# Altium project Curso_Titans.PrjPcb (part 1 of 4)
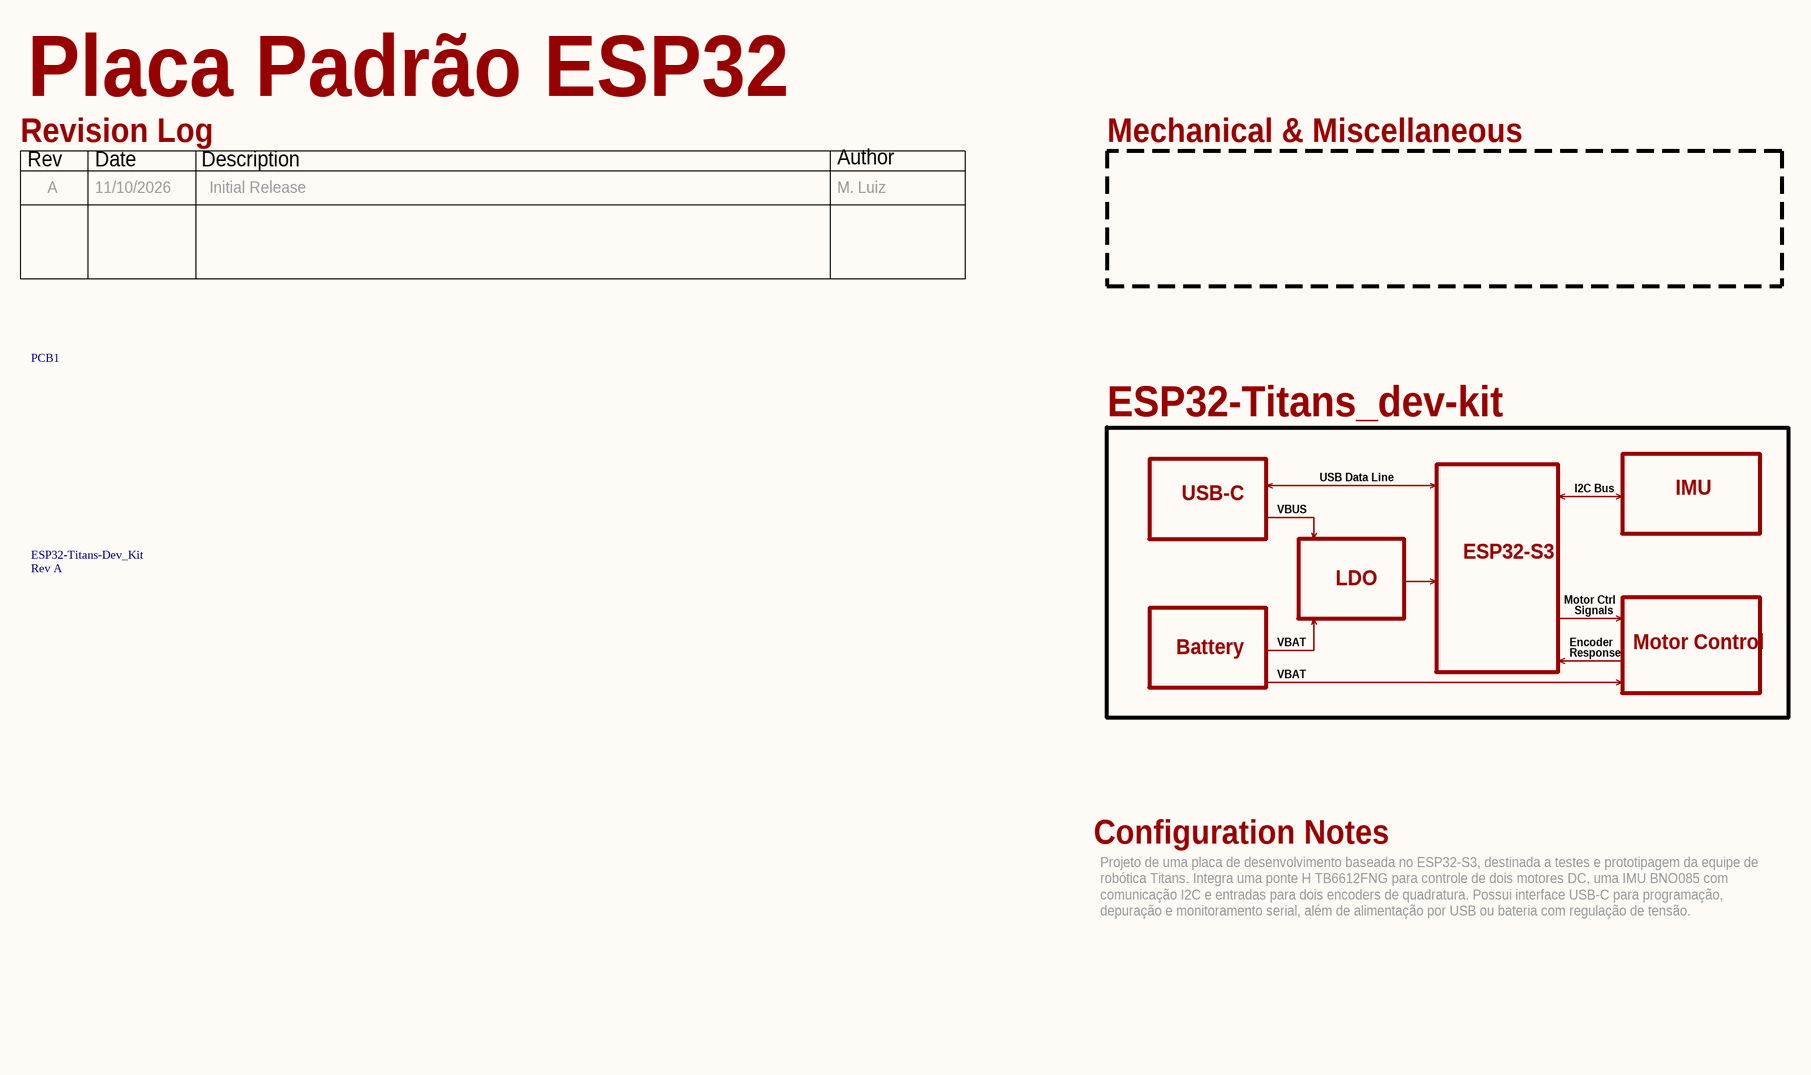
[diagram p0: cover.SchDoc]
Title: ESP32-Titans-dev_kit; Revision: A; Projeto: Curso Altium; DocumentNumber: 1; Date: 11/10/2026; CheckedBy: M. Luiz; BoardName: ESP32-Titans-Dev_Kit; Author: M. Luiz
5 sheets, 70 parts. Net scope: flat (ports and power ports of the same name join across sheets).
Board file: PCB1.PcbDoc
Sheets:
  cover.SchDoc
    ESP32-Titans_dev-kit = block_diagram.SchDoc
      Power & USB = power_supply.SchDoc
      Logic Control = logic_control.SchDoc
      Peripherials = peripherials.SchDoc

## Sheet cover.SchDoc: ESP32-Titans-Dev_kit
size 420 x 297 mm; Date: 13/10/2026; ApprovedBy: M. Luiz; CheckedBy: M. Luiz; Author: M. Luiz; CompanyName: Equipe de Robótica Titans; DrawnBy: M. Luiz; Engineer: M. Luiz; Organization: Equipe de Robótica Titans; DocumentNumber: 1; Revision: A; SheetNumber: 1; SheetTotal: 5; Projeto: Curso Altium

### Parts
PCB1  Project Name: ESP32-Titans-Dev_Kit  Board Revision: Rev A  [PCB_Logo]  (no BOM)

### Sub-sheets
ESP32-Titans_dev-kit = block_diagram.SchDoc: no entries

### Notes on the sheet
- Revision Log
- Placa Padrão ESP32
- Mechanical & Miscellaneous
- Rev
- A
- Date
- 11/10/2026
- Description
- Initial Release
- Author
- M. Luiz
- USB Data Line
- I2C Bus
- IMU
- USB-C
- VBUS
- ESP32-S3
- LDO
- Motor Ctrl
- Signals
- Battery
- VBAT
- Encoder
- Response
- Motor Control
- Configuration Notes
- Projeto de uma placa de desenvolvimento baseada no ESP32-S3, destinada a testes e prototipagem da equipe de robótica Titans. Integra uma ponte H TB6612FNG para controle de dois motores DC, uma IMU BNO085 com comunicação I2C e entradas para dois encoders de quadratura. Possui interface USB-C para programação, depuração e monitoramento serial, além de alimentação por USB ou bateria com regulação de tensão.
- Título:
- Equipe de Robótica Titans
- Projeto:
- Autor:
- Número:
- Aprovado por:
- Revisão:
- Data:
- Última Modificação:
- Página
- De

### Library data of the parts
PCB1 = BOARD INFO: Not Assembled PCB Component

## Sheet block_diagram.SchDoc: ESP32-Titans-dev_kit
size 420 x 297 mm; SheetNumber: 2; SheetTotal: 5
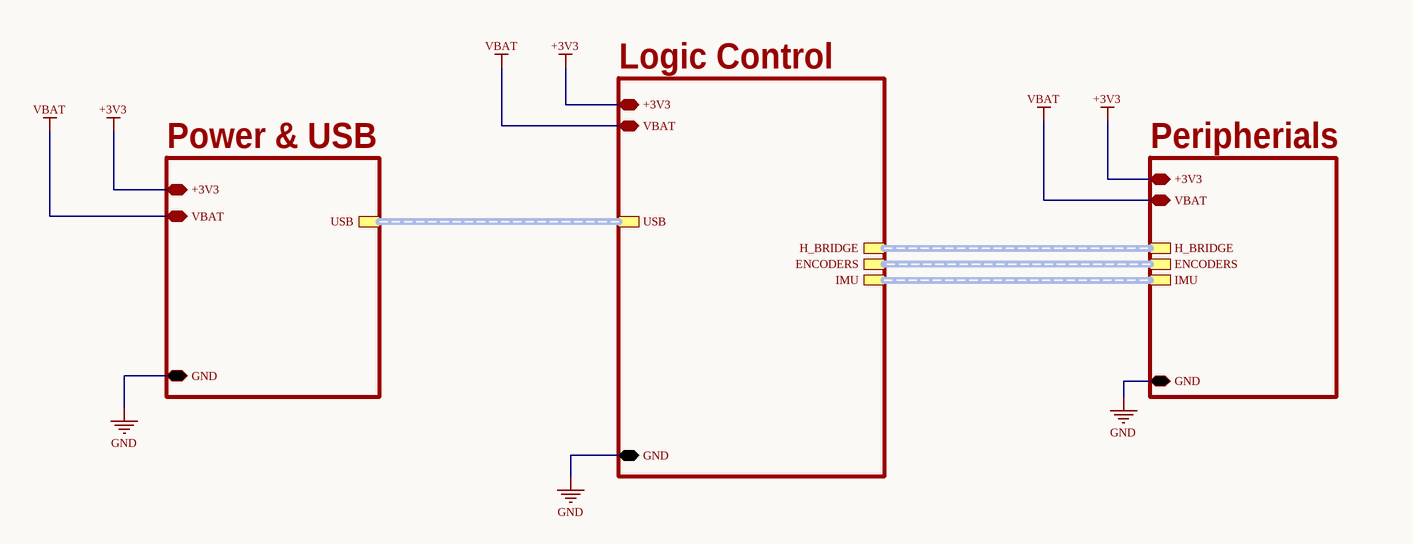
[diagram p1: block_diagram.SchDoc]

### Sub-sheets
Logic Control = logic_control.SchDoc: GND (bidir), USB (harness USB), +3V3 (bidir), VBAT (bidir), H_BRIDGE (harness H_BRIDGE), ENCODERS (harness ENCODERS), IMU (harness IMU)
Peripherials = peripherials.SchDoc: +3V3 (bidir), VBAT (bidir), GND (bidir), ENCODERS (harness ENCODERS), H_BRIDGE (harness H_BRIDGE), IMU (harness IMU)
Power & USB = power_supply.SchDoc: USB (harness USB), +3V3 (bidir), VBAT (bidir), GND (bidir)

### Nets
+3V3: sheet Power & USB/+3V3, sheet Logic Control/+3V3, sheet Peripherials/+3V3
GND: sheet Power & USB/GND, sheet Logic Control/GND, sheet Peripherials/GND
VBAT: sheet Power & USB/VBAT, sheet Logic Control/VBAT, sheet Peripherials/VBAT

### Buses and harness runs
harness sheet Logic Control/ENCODERS = sheet Peripherials/ENCODERS
harness sheet Logic Control/H_BRIDGE = sheet Peripherials/H_BRIDGE
harness sheet Logic Control/IMU = sheet Peripherials/IMU
harness sheet Logic Control/USB = sheet Power & USB/USB

### Notes on the sheet
- Título:
- Equipe de Robótica Titans
- Projeto:
- Autor:
- Número:
- Aprovado por:
- Revisão:
- Data:
- Última Modificação:
- Página
- De

## Sheet power_supply.SchDoc: ESP32-Titans-dev_kit
size 420 x 297 mm; SheetNumber: 3; SheetTotal: 5
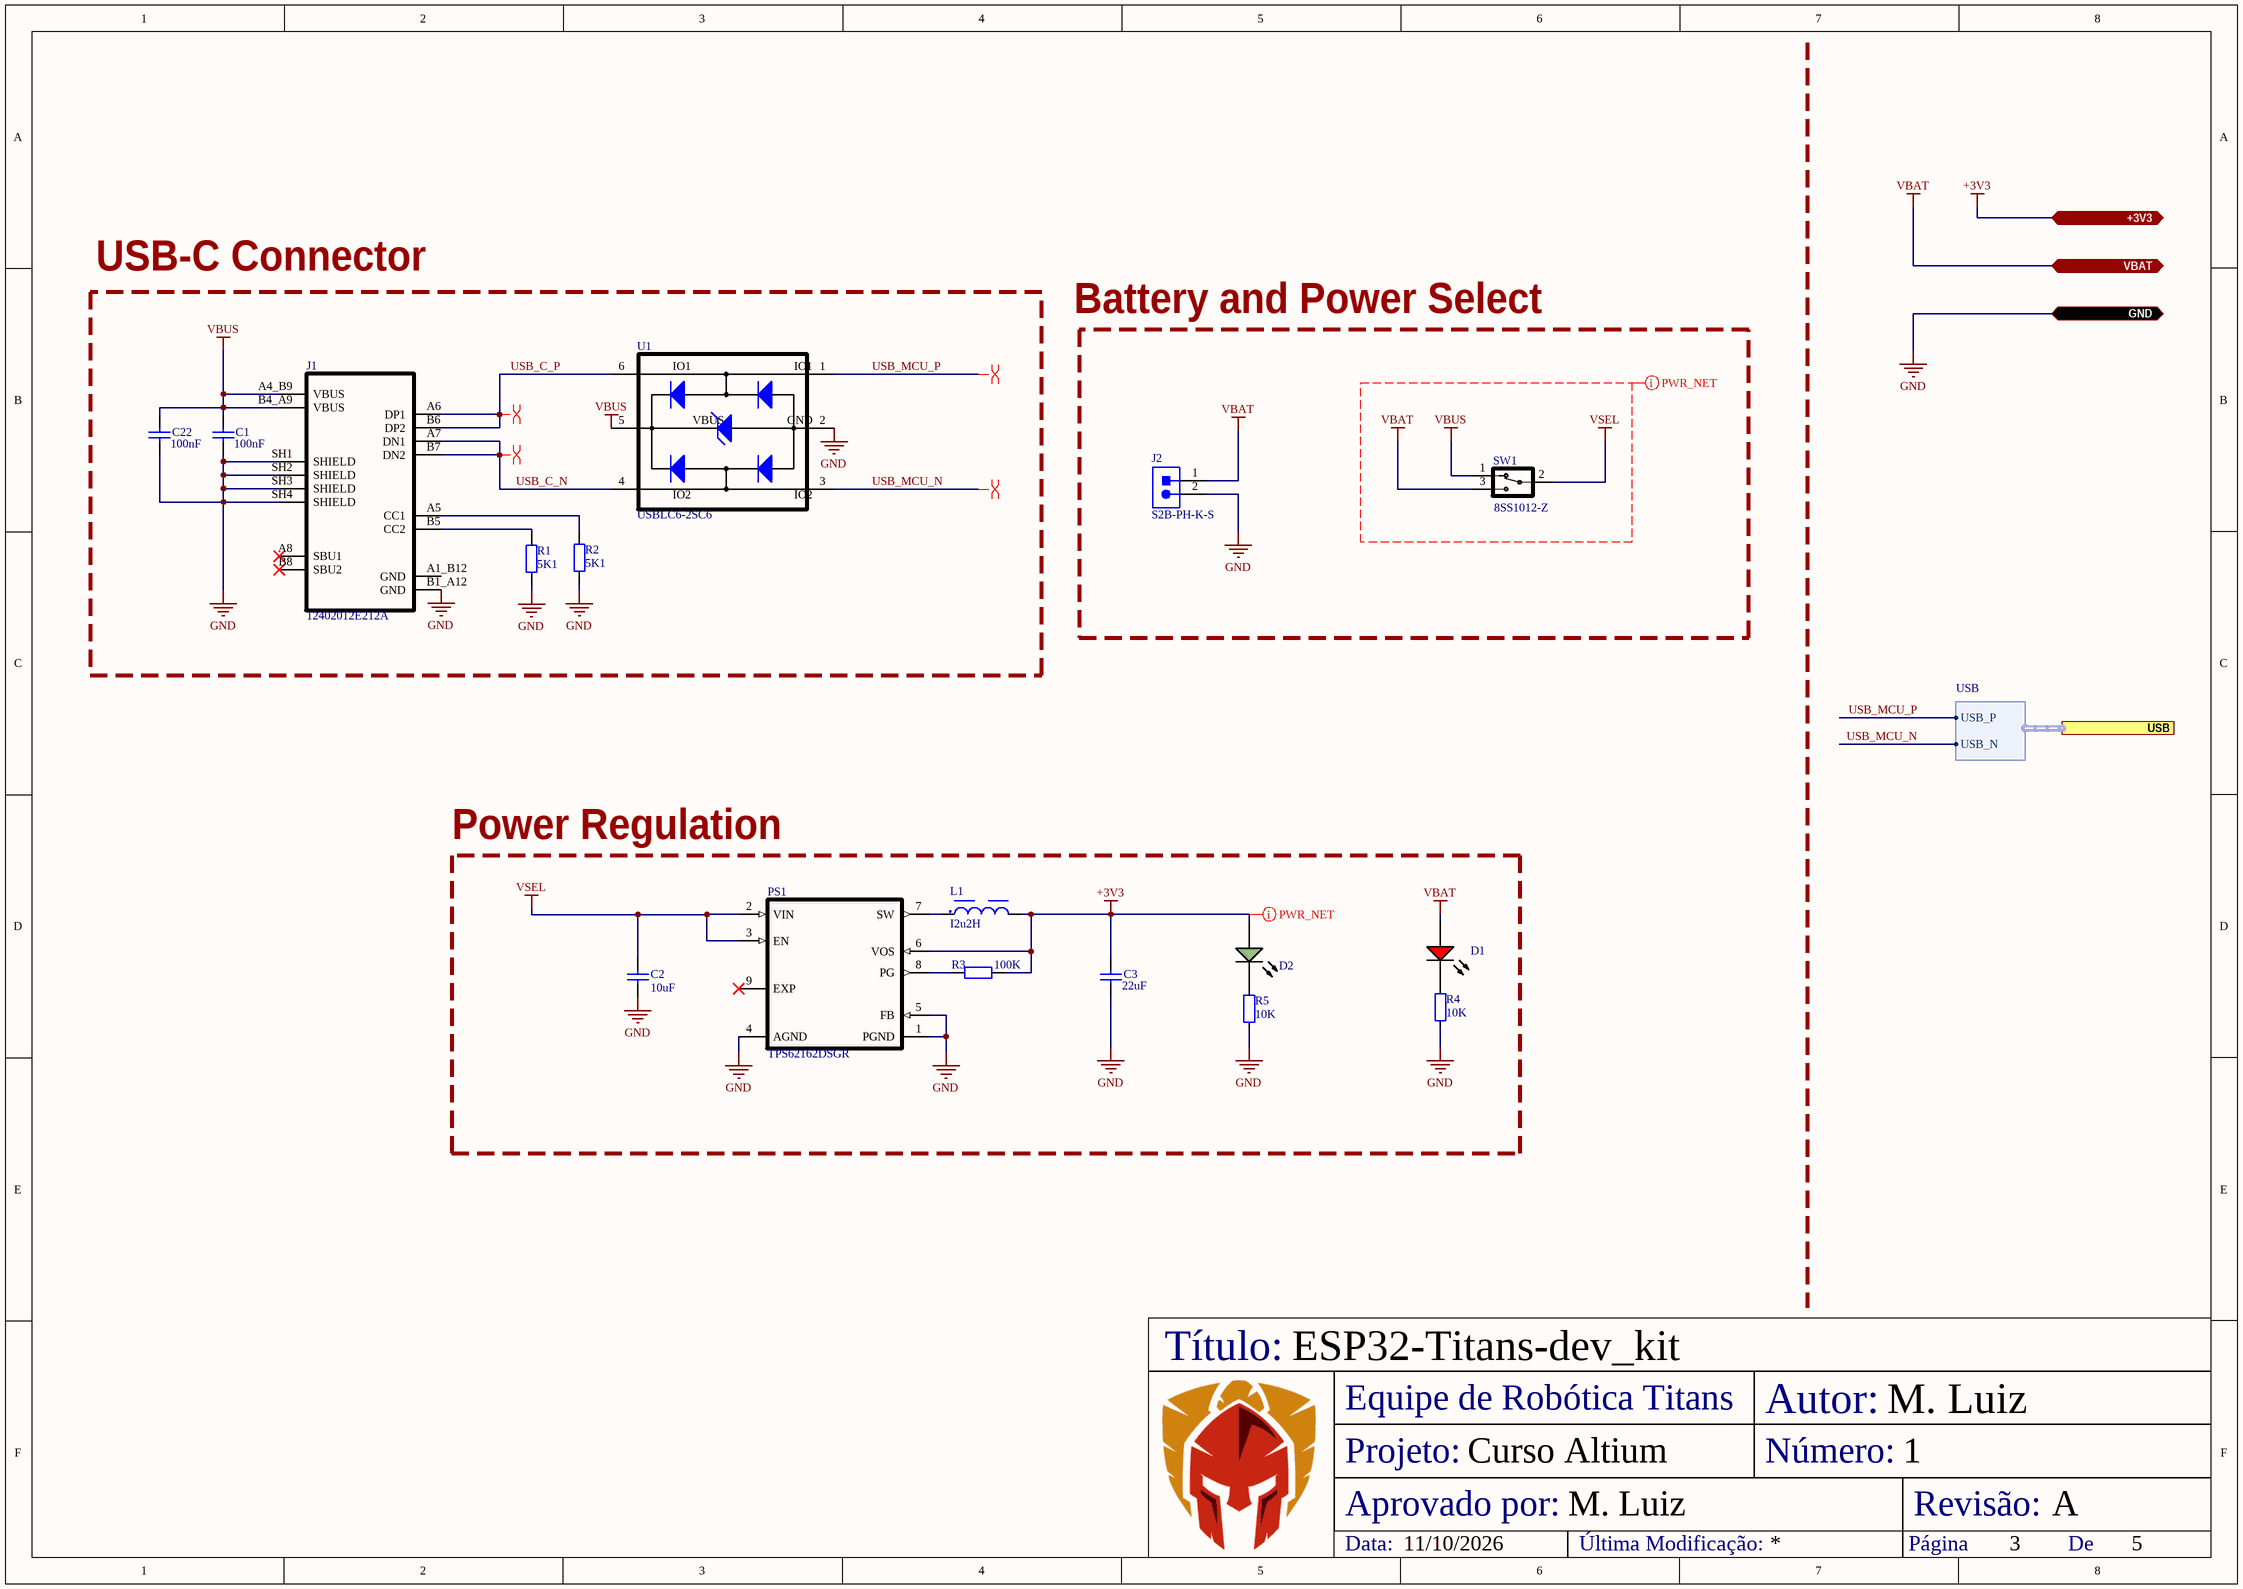
[diagram p2: power_supply.SchDoc]

### Parts
C1  value 100nF  [C0402_H0P7]  (hidden comment: CGA2B3X7R1H104K050BB)
C2  value 10uF  [C0603_H0P8]  (hidden comment: GRM188R61E106MA73D)
C3  value 22uF  [C0805_H1P45]  (hidden comment: GRM21BR61E226ME44K)
C22  value 100nF  [C0402_H0P7]  (hidden comment: CGA2B3X7R1H104K050BB)
D1  LTST-C171KRKT  [LTST-C171KXKT]  (value not drawn)
D2  LTST-C171KGKT  [LTST-C171KGKT]  (value not drawn)
J1  12402012E212A  [AMPHENOL_12402012E212A]
J2  S2B-PH-K-S  [JST-S2B-PH-K-S_V]
L1  I2u2H  [WE-LHMI_4020]
PS1  TPS62162DSGR  [SON50P200X200X80-9N]
R1  5K1  [R0402_H0P4]
R2  5K1  [R0402_H0P4]
R3  value 100K  [R0402_H0P4]  (hidden comment: RC0402FR-07100KL)
R4  value 10K  [RES0402-M]  (hidden comment: RC0402FR-0710KL)
R5  value 10K  [RES0402-M]  (hidden comment: RC0402FR-0710KL)
SW1  8SS1012-Z  [8SS1012-Z_NDC]
U1  USBLC6-2SC6  [SOT95P280X145-6N]

### Blocks framed on the sheet
USB-C Connector: C1 C22 J1 R1 R2 U1
Power Regulation: C2 C3 D1 D2 L1 PS1 R3-R5

### Ports
+3V3 (bidir, see block_diagram[3C], logic_control[8A], peripherials[8A]), GND (bidir, see block_diagram[3D], logic_control[8B], peripherials[8B]), USB (harness USB, see block_diagram[3C], logic_control[8C]), VBAT (bidir, see block_diagram[3C], logic_control[8A], peripherials[8A])

### Harnesses
USB: USB_P, USB_N

### Nets
+3V3: C3.1 D2.2(K) L1.2 PS1.6(VOS) R3.1 ; port +3V3
GND: C1.2 C2.2 C3.2 C22.2 J1.B1_A12(GND) J1.SH1(SHIELD) J1.SH2(SHIELD) J1.SH3(SHIELD) J1.SH4(SHIELD) J2.2 PS1.1(PGND) PS1.4(AGND) PS1.5(FB) R1.1 R2.1 R4.2 R5.2 U1.2(GND) ; port GND
VBAT: D1.2(K) J2.1 SW1.3 ; port VBAT
VBUS: C1.1 C22.1 J1.A4_B9(VBUS) J1.B4_A9(VBUS) SW1.1 U1.5(VBUS)
VSEL: C2.1 PS1.2(VIN) PS1.3(EN) SW1.2
USB_C_N: J1.A7(DN1) J1.B7(DN2) U1.4(I/O2_2)
USB_C_P: J1.A6(DP1) J1.B6(DP2) U1.6(I/O1_2)
USB_MCU_N: U1.3(I/O2_1) ; port USB.USB_N
USB_MCU_P: U1.1(I/O1_1) ; port USB.USB_P
NetD1_1: D1.1(A) R4.1
NetD2_1: D2.1(A) R5.1
NetJ1_A5: J1.A5(CC1) R2.2
NetJ1_B5: J1.B5(CC2) R1.2
NetL1_1: L1.1 PS1.7(SW)
NetPS1_8: PS1.8(PG) R3.2

Not connected (* = marked no-connect by the designer): J1 A1_B12(GND) A8(SBU1)* B8(SBU2)*; PS1 9(EXP)*

### Layout directives
differential pair: USB_C_N, USB_C_P, USB_MCU_N, USB_MCU_P
net class POWER_NET: +3V3, VBAT, VBUS, VSEL

### Notes on the sheet
- Battery and Power Select
- Título:
- Equipe de Robótica Titans
- Projeto:
- Autor:
- Número:
- Aprovado por:
- Revisão:
- Data:
- Última Modificação:
- Página
- De
- (in symbol USBLC6-2SC6) IO1; IO2

### Library data of the parts
C1 C22 = C0.1uF 50V 0402: C0.1uF 50V X7R 10% 0402; Manufacturer: TDK; Dielectric Material: Ceramic; Multilayer: Yes; Reference Standard: AEC-Q200; Supplier: Digikey; Supplier Part Number: 445-6899-1-ND; Manufacturer Part Number: CGA2B3X7R1H104K050BB; RoHS: Yes; Category: Ceramic Capacitors; Stock: 2155708; Pricing: 1=0.13, 10=0.075, 100=0.0451, 1000=0.02937, 2500=0.02541, 5000=0.02301 (USD); Mounting Technology: Surface Mount; Pins: 2; Package Shape: Rectangular; Case/Package: 0402; Terminal Finish: Nickel; Min Operating Temperature: -55°C; Max Operating Temperature: 125°C; JESD-609 Code: e3; Capacitor Type: Ceramic; Tolerance  (fill in as +-): 10%; Package Style: SMTMeter; Packaging: Tape and Reel; Tolerance (fill in as +-): 10%; Rated DC Voltage (URdc): 50V; Temperature Characteristics Code: X7R; Termination: Wraparound; Length: 1mm; Width: 0.5mm; Height: 0.5mm; Reach SVHC Compliant: Yes; RoHS Compliant: Yes; ComponentLink1URL: https://datasheet.ciiva.com:443/pdfs/VipMasterIC/IC/TDKC/TDKC-S-A0008953915/TDKC-S-A0008953915-1.pdf?src-supplier=IHS+Markit; ComponentLink1Description: https://datasheet.ciiva.com:443/pdfs/VipMasterIC/IC/TDKC/TDKC-S-A0008953915/TDKC-S-A0008953915-1.pdf?src-supplier=IHS+Markit; ComponentLink2URL: https://datasheet.ciiva.com/16498/mlccspec-automotive-general-midvoltage-en-16498528.pdf?src-supplier=Future+Electronics; ComponentLink2Description: https://datasheet.ciiva.com/16498/mlccspec-automotive-general-midvoltage-en-16498528.pdf?src-supplier=Future+Electronics; ComponentLink3URL: https://datasheet.ciiva.com/24216/cga2b3x7r1h104k050bb-266281-24216070.pdf?src-supplier=Mouser; ComponentLink3Description: https://datasheet.ciiva.com/24216/cga2b3x7r1h104k050bb-266281-24216070.pdf?src-supplier=Mouser; ComponentLink4URL: https://datasheet.ciiva.com/22725/1735392-22725627.pdf?src-supplier=Element14; ComponentLink4Description: https://datasheet.ciiva.com/22725/1735392-22725627.pdf?src-supplier=Element14; Supplier 1: DigiKey; Supplier Part Number 1: 445-6899-1-ND
C2 = C10uF 25V 0603: 10uF 25V X5R 20% 0603; Manufacturer: Murata Electronics North America; Internal Code: 0-ECCAP10uX5RV25%20P0603-; Type: Capacitor; Package: 0603; Manufacturer Part Number: GRM188R61E106MA73D; Supplier 1: DigiKey; Supplier Part Number 1: 490-7202-1-ND; Supplier Link 1: https://www.digikey.com/products/en?keywords=490-7202-1-ND; Datasheet: https://www.murata.com/~/media/webrenewal/support/library/catalog/products/capacitor/mlcc/c02e.ashx?la=en-us; Tolerance: 20%; Packaging: Cut Tape; RoHS Compliant: Yes; Temp Coef: X5R; Voltage: 25V
C3 = C22uF 25V 0805: 22uF 25V X5R 20% 0805; Manufacturer: Murata; Dielectric Material: Ceramic; Multilayer: Yes; Supplier: Mouser; Supplier Part Number: 81-GRM21BR61E226ME4K; Manufacturer Part Number: GRM21BR61E226ME44K; RoHS: Yes; Category: Ceramic Capacitors; Stock: 19596; Pricing: 1=0.32, 10=0.198, 50=0.198, 100=0.129, 1000=0.092, 10000=0.069 (USD); Mounting Technology: Surface Mount; Pins: 2; Package Shape: Rectangular; Case/Package: 0805; Terminal Finish: Nickel; Min Operating Temperature: -55°C; Max Operating Temperature: 85°C; JESD-609 Code: e3; Capacitor Type: Ceramic; Tolerance  (fill in as +-): 20%; Package Style: SMTMeter; Packaging: Tape and Reel; Tolerance (fill in as +-): 20%; Termination: Wraparound; Length: 2mm; Width: 1.25mm; Height: 1.25mm; Reach SVHC Compliant: Yes; RoHS Compliant: Yes; ComponentLink1URL: https://datasheet.ciiva.com:443/pdfs/VipMasterIC/IC/MURE/MURE-S-A0002977178/MURE-S-A0002978778-1.pdf?src-supplier=IHS+Markit; ComponentLink1Description: https://datasheet.ciiva.com:443/pdfs/VipMasterIC/IC/MURE/MURE-S-A0002977178/MURE-S-A0002978778-1.pdf?src-supplier=IHS+Markit; ComponentLink2URL: http://www.mouser.com/ds/2/281/c02e-2905.pdf?src-supplier=Mouser; ComponentLink2Description: http://www.mouser.com/ds/2/281/c02e-2905.pdf?src-supplier=Mouser; ComponentLink3URL: https://datasheet.octopart.com/GRM21BR61E226ME44K-Murata-datasheet-155345081.pdf?src-supplier=Element14; ComponentLink3Description: https://datasheet.octopart.com/GRM21BR61E226ME44K-Murata-datasheet-155345081.pdf?src-supplier=Element14; ComponentLink4URL: http://search.murata.co.jp/Ceramy/image/img/A01X/G101/ENG/GRM21BR61E226ME44-01.pdf?src-supplier=Digikey; ComponentLink4Description: http://search.murata.co.jp/Ceramy/image/img/A01X/G101/ENG/GRM21BR61E226ME44-01.pdf?src-supplier=Digikey; ComponentLink5URL: https://search.murata.co.jp/Ceramy/image/img/A01X/G101/ENG/GRM21BR61E226ME44-01.pdf?src-supplier=Digikey; ComponentLink5Description: https://search.murata.co.jp/Ceramy/image/img/A01X/G101/ENG/GRM21BR61E226ME44-01.pdf?src-supplier=Digikey; ComponentLink6URL: https://datasheet.octopart.com/GRM21BR61E226ME44K-Murata-datasheet-99353850.pdf?src-supplier=Future+Electronics; ComponentLink6Description: https://datasheet.octopart.com/GRM21BR61E226ME44K-Murata-datasheet-99353850.pdf?src-supplier=Future+Electronics; ComponentLink7URL: https://datasheet.octopart.com/GRM21BR61E226ME44K-Murata-datasheet-155345081.pdf?src-supplier=Newark; ComponentLink7Description: https://datasheet.octopart.com/GRM21BR61E226ME44K-Murata-datasheet-155345081.pdf?src-supplier=Newark; ComponentLink8URL: https://datasheet.octopart.com/GRM21BR61E226ME44K-Murata-datasheet-165579666.pdf?src-supplier=TME; ComponentLink8Description: https://datasheet.octopart.com/GRM21BR61E226ME44K-Murata-datasheet-165579666.pdf?src-supplier=TME; Rated DC Voltage (URdc): 25V; Temperature Characteristics Code: X5R
D1 = LTST-C171KRKT: LED RED 0805 wavelength 639nm light intensity 35mcd Front Mounting; Manufacturer: Lite-On; Forward Current: 30mA; Forward Voltage: 2V; Lens Color: Clear, Colorless; Lens Style: Clear; Number of Circuits: 1; Power Dissipation: 75mW; Reverse Voltage: 5V; Shape: Rectangular; Test Current: 20mA; Viewing Angle: 130°; Wavelength: 570nm; Supplier: DigiKey; Supplier Part Number: 160-1427-1-ND; Manufacturer Part Number: LTST-C171KRKT; RoHS: Compliant; Category: LEDs; Stock: 263738; Pricing: 1=0.11, 10=0.077, 100=0.0529, 500=0.04166, 1000=0.03789 (USD); Case/Package: 0805; Case Code (Imperial): 0805; Case Code (Metric): 2012; China RoHS: Compliant; Color: RED; Depth: 1.25mm; Dominant Wavelength: 639nm; Height: 800µm; Illumination Color: RED; Lead Free: Lead Free; Length: 2mm; Lens Transparency: Clear; Lifecycle Status: Production; Luminous Intensity: 35mcd; Max Operating Temperature: 85°C; Min Operating Temperature: -55°C; Mounting Technology: Surface Mount; Number of Elements: 1; Number of LEDs: 1; Pins: 2; Number of Terminals: 2; Peak Wavelength: 639nm; Power Rating: 75mW; Radiation Hardening: No; REACH SVHC: Yes; Schedule B: 8541402000, 8541402000|8541402000|8541402000|8541402000|8541402000; Terminal Pitch: 2.5mm; Width: 1.25mm; ComponentLink1URL: https://datasheet.octopart.com:443/LTST-C171KGKT-Lite-On-datasheet-62340967.pdf?src-supplier=ODG+(Origin+Data+Global); ComponentLink1Description: https://datasheet.octopart.com:443/LTST-C171KGKT-Lite-On-datasheet-62340967.pdf?src-supplier=ODG+(Origin+Data+Global); ComponentLink2URL: https://datasheet.octopart.com:443/LTST-C171KGKT-Lite-On-datasheet-180605161.pdf?src-supplier=IHS; ComponentLink2Description: https://datasheet.octopart.com:443/LTST-C171KGKT-Lite-On-datasheet-180605161.pdf?src-supplier=IHS; ComponentLink3URL: https://datasheet.octopart.com:443/LTST-C171KGKT-Lite-On-datasheet-159335.pdf?src-supplier=_legacy+Avnet; ComponentLink3Description: https://datasheet.octopart.com:443/LTST-C171KGKT-Lite-On-datasheet-159335.pdf?src-supplier=_legacy+Avnet; ComponentLink4URL: https://datasheet.octopart.com:443/LTST-C171KGKT-Lite-On-datasheet-166322636.pdf?src-supplier=TME; ComponentLink4Description: https://datasheet.octopart.com:443/LTST-C171KGKT-Lite-On-datasheet-166322636.pdf?src-supplier=TME; ComponentLink5URL: https://datasheet.octopart.com:443/LTST-C171KGKT-Lite-On-datasheet-165573808.pdf?src-supplier=TME; ComponentLink5Description: https://datasheet.octopart.com:443/LTST-C171KGKT-Lite-On-datasheet-165573808.pdf?src-supplier=TME; ComponentLink6URL: https://datasheet.octopart.com:443/LTST-C171KGKT-Lite-On-datasheet-137080783.pdf?src-supplier=X-ON; ComponentLink6Description: https://datasheet.octopart.com:443/LTST-C171KGKT-Lite-On-datasheet-137080783.pdf?src-supplier=X-ON; ComponentLink7URL: https://datasheet.octopart.com:443/LTST-C171KGKT-Lite-On-datasheet-8328465.pdf?src-supplier=Future+Electronics; ComponentLink7Description: https://datasheet.octopart.com:443/LTST-C171KGKT-Lite-On-datasheet-8328465.pdf?src-supplier=Future+Electronics; ComponentLink8URL: https://datasheet.octopart.com:443/LTST-C171KGKT-Lite-On-datasheet-19967.pdf?src-supplier=DigiKey; ComponentLink8Description: https://datasheet.octopart.com:443/LTST-C171KGKT-Lite-On-datasheet-19967.pdf?src-supplier=DigiKey; ComponentLink9URL: https://datasheet.octopart.com:443/LTST-C171KGKT-Lite-On-datasheet-14175002.pdf?src-supplier=iiiC; ComponentLink9Description: https://datasheet.octopart.com:443/LTST-C171KGKT-Lite-On-datasheet-14175002.pdf?src-supplier=iiiC; Supplier 1: DigiKey; Supplier Part Number 1: 160-1426-1-ND; Supplier 2: DigiKey; Supplier Part Number 2: 160-1426-2-ND; Supplier 3: Mouser; Supplier Part Number 3: 859-LTST-C171KGKT
D2 = LTST-C171KGKT: LED yellow green 0805 wavelength 571nm light intensity 35mcd Front Mounting; Manufacturer: Lite-On; Forward Current: 30mA; Forward Voltage: 2V; Lens Color: Clear, Colorless; Lens Style: Clear; Number of Circuits: 1; Peak Wavelength: 574nm; Power Dissipation: 75mW; Reverse Voltage: 5V; Shape: Rectangular; Test Current: 20mA; Viewing Angle: 130°; Wavelength: 570nm; Supplier: DigiKey; Supplier Part Number: 160-1426-1-ND; Manufacturer Part Number: LTST-C171KGKT; RoHS: Compliant; Category: LEDs; Stock: 263738; Pricing: 1=0.11, 10=0.077, 100=0.0529, 500=0.04166, 1000=0.03789 (USD); Case/Package: 0805; Case Code (Imperial): 0805; Case Code (Metric): 2012; China RoHS: Compliant; Color: Green; Depth: 1.25mm; Dominant Wavelength: 571nm; Height: 800µm; Illumination Color: Green; Lead Free: Lead Free; Length: 2mm; Lens Transparency: Clear; Lifecycle Status: Production; Luminous Intensity: 35mcd; Max Operating Temperature: 85°C; Min Operating Temperature: -55°C; Mounting Technology: Surface Mount; Number of Elements: 1; Number of LEDs: 1; Pins: 2; Number of Terminals: 2; Power Rating: 75mW; Radiation Hardening: No; REACH SVHC: Yes; Schedule B: 8541402000, 8541402000|8541402000|8541402000|8541402000|8541402000; Terminal Pitch: 2.5mm; Width: 1.25mm; ComponentLink1URL: https://datasheet.octopart.com:443/LTST-C171KGKT-Lite-On-datasheet-62340967.pdf?src-supplier=ODG+(Origin+Data+Global); ComponentLink1Description: https://datasheet.octopart.com:443/LTST-C171KGKT-Lite-On-datasheet-62340967.pdf?src-supplier=ODG+(Origin+Data+Global); ComponentLink2URL: https://datasheet.octopart.com:443/LTST-C171KGKT-Lite-On-datasheet-180605161.pdf?src-supplier=IHS; ComponentLink2Description: https://datasheet.octopart.com:443/LTST-C171KGKT-Lite-On-datasheet-180605161.pdf?src-supplier=IHS; ComponentLink3URL: https://datasheet.octopart.com:443/LTST-C171KGKT-Lite-On-datasheet-159335.pdf?src-supplier=_legacy+Avnet; ComponentLink3Description: https://datasheet.octopart.com:443/LTST-C171KGKT-Lite-On-datasheet-159335.pdf?src-supplier=_legacy+Avnet; ComponentLink4URL: https://datasheet.octopart.com:443/LTST-C171KGKT-Lite-On-datasheet-166322636.pdf?src-supplier=TME; ComponentLink4Description: https://datasheet.octopart.com:443/LTST-C171KGKT-Lite-On-datasheet-166322636.pdf?src-supplier=TME; ComponentLink5URL: https://datasheet.octopart.com:443/LTST-C171KGKT-Lite-On-datasheet-165573808.pdf?src-supplier=TME; ComponentLink5Description: https://datasheet.octopart.com:443/LTST-C171KGKT-Lite-On-datasheet-165573808.pdf?src-supplier=TME; ComponentLink6URL: https://datasheet.octopart.com:443/LTST-C171KGKT-Lite-On-datasheet-137080783.pdf?src-supplier=X-ON; ComponentLink6Description: https://datasheet.octopart.com:443/LTST-C171KGKT-Lite-On-datasheet-137080783.pdf?src-supplier=X-ON; ComponentLink7URL: https://datasheet.octopart.com:443/LTST-C171KGKT-Lite-On-datasheet-8328465.pdf?src-supplier=Future+Electronics; ComponentLink7Description: https://datasheet.octopart.com:443/LTST-C171KGKT-Lite-On-datasheet-8328465.pdf?src-supplier=Future+Electronics; ComponentLink8URL: https://datasheet.octopart.com:443/LTST-C171KGKT-Lite-On-datasheet-19967.pdf?src-supplier=DigiKey; ComponentLink8Description: https://datasheet.octopart.com:443/LTST-C171KGKT-Lite-On-datasheet-19967.pdf?src-supplier=DigiKey; ComponentLink9URL: https://datasheet.octopart.com:443/LTST-C171KGKT-Lite-On-datasheet-14175002.pdf?src-supplier=iiiC; ComponentLink9Description: https://datasheet.octopart.com:443/LTST-C171KGKT-Lite-On-datasheet-14175002.pdf?src-supplier=iiiC; Supplier 1: DigiKey; Supplier Part Number 1: 160-1426-1-ND; Supplier 2: DigiKey; Supplier Part Number 2: 160-1426-2-ND; Supplier 3: Mouser; Supplier Part Number 3: 859-LTST-C171KGKT
J1 = USB-C Conn: USB Connector, USB Type C, USB 2.0, Receptacle, 24 Ways, Surface Mount, Through Hole Mount; Manufacturer: Amphenol; Contact Resistance: 40mΩ; Current Rating: 5A; Insulation Resistance: 100MΩ; Number of Ports: 1; Supplier: DigiKey; Supplier Part Number: 664-12402012E212ACT-ND; Manufacturer Part Number: 12402012E212A; RoHS: Compliant; Category: Connectors; Stock: 15000; Pricing: 1=0.61, 10=0.517, 25=0.4848, 50=0.4616, 100=0.4396, 250=0.41204 (USD); Contact Gender: Male; Lifecycle Status: Production; Pins: 24; Number of Rows: 1; REACH SVHC: Yes; Shell Finish: Nickel; Shell Material: Stainless Steel; Terminal Pitch: 500µm; ComponentLink1URL: https://datasheet.octopart.com:443/12402012E212A-Amphenol-Communications-Solutions-datasheet-182242347.pdf?src-supplier=IHS; ComponentLink1Description: https://datasheet.octopart.com:443/12402012E212A-Amphenol-Communications-Solutions-datasheet-182242347.pdf?src-supplier=IHS; Supplier 1: DigiKey; Supplier Part Number 1: 664-12402012E212ACT-ND; Supplier 2: DigiKey; Supplier Part Number 2: 664-12402012E212ATR-ND; Supplier 3: Mouser; Supplier Part Number 3: 523-12402012E212A
J2 = S2B-PH-K-S: Conn Shrouded Header (4 Sides) HDR 2 POS 2mm Solder RA Side Entry Thru-Hole Box; Manufacturer: JST; Manufacturer Part Number: S2B-PH-K-S(LF)(SN); Value: 10µF; Connector Type: Male Pin; Contact Resistance: 20mΩ; Current Rating: 2A; Gender: Male; Insulation Resistance: 1GΩ; Max Voltage Rating (AC): 100V; Number of Contacts: 2; Tolerance: 20%; Voltage Rating: 50V; Supplier: LCSC; Supplier Part Number: C173752; RoHS: Compliant; Category: Headers and Wire Housings; Stock: 45740; Pricing: 20=0.253, 20=0.0301, 20=0.2762, 20=0.0346, 200=0.1981, 200=0.0236, 200=0.2163, 200=0.0271, 1000=0.1674, 1000=0.02, 1000=0.1828, 1000=0.0229, 2000=0.1492, 2000=0.0178, 2000=0.1628, 2000=0.0204, 10000=0.1338, 10000=0.016, 10000=0.1461, 10000=0.0183, 20000=0.125, 20000=0.0149, 20000=0.1365, 20000=0.0171 (CNY); Case/Package: Radial; China RoHS: Compliant; Color: Natural, White; Contact Gender: Male; Contact Material: Brass; Contact Mating Length: 3.302mm; Contact Plating: Tin; Depth: 7.6mm; Diameter: 5mm; Fastening Type: Detent; Flammability Rating: UL94 V-0; Height: 11mm; Lead Free: Lead Free; Lead Pitch: 2mm; Length: 11mm; Lifecycle Status: Production; Max Current Rating: 2A; Max Operating Temperature: 85°C; Max Voltage Rating (DC): 100V; Min Operating Temperature: -25°C; Mounting Technology: Through Hole; Pins: 2; Number of Poles: 2; Number of Positions: 2; Number of Rows: 1; Orientation: Right Angle; Packaging: Bulk; Pitch: 2mm; Radiation Hardening: No; REACH SVHC: Yes; Terminal Pitch: 2mm; Termination: Solder; Voltage Rating (AC): 100V; Voltage Rating (DC): 50V; Weight: 28.349523g; Width: 4.5mm; Working Voltage: 100V; ComponentLink1URL: https://datasheet.octopart.com:443/S2B-PH-K-S%28LF%29%28SN%29-JST-datasheet-180491669.pdf?src-supplier=IHS; ComponentLink1Description: https://datasheet.octopart.com:443/S2B-PH-K-S%28LF%29%28SN%29-JST-datasheet-180491669.pdf?src-supplier=IHS; ComponentLink2URL: https://datasheet.octopart.com:443/S2B-PH-K-S%28LF%29%28SN%29-JST-datasheet-10411123.pdf?src-supplier=Upverter; ComponentLink2Description: https://datasheet.octopart.com:443/S2B-PH-K-S%28LF%29%28SN%29-JST-datasheet-10411123.pdf?src-supplier=Upverter; ComponentLink3URL: https://datasheet.octopart.com:443/S2B-PH-K-S%28LF%29%28SN%29-JST-datasheet-8324864.pdf?src-supplier=Upverter; ComponentLink3Description: https://datasheet.octopart.com:443/S2B-PH-K-S%28LF%29%28SN%29-JST-datasheet-8324864.pdf?src-supplier=Upverter; ComponentLink4URL: https://datasheet.octopart.com:443/S2B-PH-K-S%28LF%29%28SN%29-JST-datasheet-56537.pdf?src-supplier=Upverter; ComponentLink4Description: https://datasheet.octopart.com:443/S2B-PH-K-S%28LF%29%28SN%29-JST-datasheet-56537.pdf?src-supplier=Upverter; ComponentLink5URL: https://datasheet.octopart.com:443/S2B-PH-K-S%28LF%29%28SN%29-JST-datasheet-15068535.pdf?src-supplier=Upverter; ComponentLink5Description: https://datasheet.octopart.com:443/S2B-PH-K-S%28LF%29%28SN%29-JST-datasheet-15068535.pdf?src-supplier=Upverter; ComponentLink6URL: https://datasheet.octopart.com:443/S2B-PH-K-S%28LF%29%28SN%29-JST-datasheet-147762421.pdf?src-supplier=LKR; ComponentLink6Description: https://datasheet.octopart.com:443/S2B-PH-K-S%28LF%29%28SN%29-JST-datasheet-147762421.pdf?src-supplier=LKR; ComponentLink7URL: https://datasheet.octopart.com:443/S2B-PH-K-S%28LF%29%28SN%29-JST-datasheet-12510261.pdf?src-supplier=Future+Electronics; ComponentLink7Description: https://datasheet.octopart.com:443/S2B-PH-K-S%28LF%29%28SN%29-JST-datasheet-12510261.pdf?src-supplier=Future+Electronics; Supplier 1: LCSC; Supplier Part Number 1: C173752; Supplier 2: Mouser; Supplier Part Number 2: 306-S2BPHKSLFSNPP
L1 = I2u2H: FIXED IND 2.2UH 3.25A 0.061OHM; MF: WÃ¼rth Elektronik; MP: 74437324022; SnapEDA_Link: https://www.snapeda.com/parts/74437324022/W%25C3%25BCrth+Elektronik+Midcom/view-part/?ref=snap; Package: Nonstandard WÃ¼rth Elektronik; Value: *; Check_prices: https://www.snapeda.com/parts/74437324022/W%25C3%25BCrth+Elektronik+Midcom/view-part/?ref=eda
PS1 = TPS62162DSGR: 3V-17V 1A Step-Down Converters with DCS-Controlâ„¢; MF: Texas Instruments; SnapEDA_Link: https://www.snapeda.com/parts/TPS62162DSGR/Texas+Instruments/view-part/?ref=snap; Package: WSON-8 Texas Instruments; Value: *; MP: TPS62162DSGR; Check_prices: https://www.snapeda.com/parts/TPS62162DSGR/Texas+Instruments/view-part/?ref=eda
R1 R2 = R5K1 1% 0402: 5K1 1% 0402 1/16W; Manufacturer: Stackpole Electronics Inc; Manufacturer Part Number: RMCF0402FT5K10; Internal Code: 0-ECRES5K1%01P0402-SI; Tolerance: 1%; Package: 0402; Supplier 1: DigiKey; Supplier Part Number 1: RMCF0402FT5K10CT-ND; Supplier Link 1: https://www.digikey.com/product-detail/en/stackpole-electronics-inc/RMCF0402FT5K10/RMCF0402FT5K10CT-ND/2417741; Datasheet: https://www.seielect.com/catalog/sei-rmcf_rmcp.pdf; Type: Resistor; Power: 1/16W; Value: 5K1
R3 = R100K 1% 0402: 100K 1% 0402 1/16W; Manufacturer: Yageo; Package: 0402; Manufacturer Part Number: RC0402FR-07100KL; Supplier 1: Digikey; Supplier Part Number 1: 311-100KLRCT-ND; Supplier Link 1: https://www.digikey.com/product-detail/en/yageo/RC0402FR-07100KL/311-100KLRCT-ND/729473; Type: Resistor; Power: 1/16W; Tolerance: 1%
R4 R5 = R10K 1% 0402: Res Thick Film 0402 10K Ohm 1% 0.063W(1/16W) ±100ppm/C Pad SMD T/R; Manufacturer: Yageo Group; Power Dissipation: 62.5mW; Power Rating: 63mW; Temperature Coefficient: 100ppm/°C; Voltage Rating: 50V; Supplier: DigiKey; Supplier Part Number: 311-10.0KLRDKR-ND; Manufacturer Part Number: RC0402FR-0710KL; RoHS: Compliant; Category: Chip SMD Resistors; Stock: 4103358; Pricing: 1=0.1, 10=0.010, 25=0.0072, 50=0.004 (USD); Case/Package: 0402; Case Code (Imperial): 0402; Case Code (Metric): 0402; China RoHS: Non-Compliant; Composition: Thick Film; Depth: 500µm; Height: 350µm; Lead Free: Lead Free; Lead Pitch: 200µm; Length: 1mm; Lifecycle Status: Production; Max Operating Temperature: 155°C; Military Standard: Not; Min Operating Temperature: -55°C; Mounting Technology: Surface Mount; Pins: 2; Number of Terminals: 2; Number of Terminations: 2; Packaging: Tape & Reel; REACH SVHC: Yes; Schedule B: 8533210045, 8533210045|8533210045|8533210045|8533210045|8533210045|8533210045|8533210045|8533210045|8533210045|8533210045|8533210045|8533210045|8533210045|8533210045, 8533210045|8533210045|8533210045|8533210045|8533210045|8533210045|8533210045|8533210045|8533210045|8533210045|8533210045|8533210045|8533210045|8533210045|8533210045, 8533210045|8533210045|8533210045|8533210045|8533210045|8533210045|8533210045|8533210045|8533210045|8533210045|8533210045|8533210045|8533210045|8533210045|8533210045|8533210045; Termination: SMD/SMT; Tolerance: 1%; Voltage Rating (DC): 50V; Width: 500µm; Working Voltage: 50V; ComponentLink1URL: https://datasheet.octopart.com:443/RC0402FR-0710KL-Yageo-datasheet-175887523.pdf?src-supplier=Newark; ComponentLink1Description: https://datasheet.octopart.com:443/RC0402FR-0710KL-Yageo-datasheet-175887523.pdf?src-supplier=Newark; ComponentLink2URL: https://datasheet.octopart.com:443/RC0402FR-0710KL-Yageo-Group-datasheet-190305687.pdf?src-supplier=Newark; ComponentLink2Description: https://datasheet.octopart.com:443/RC0402FR-0710KL-Yageo-Group-datasheet-190305687.pdf?src-supplier=Newark; ComponentLink3URL: https://datasheet.octopart.com:443/RC0402FR-0710KL-Yageo-datasheet-12531192.pdf?src-supplier=Newark; ComponentLink3Description: https://datasheet.octopart.com:443/RC0402FR-0710KL-Yageo-datasheet-12531192.pdf?src-supplier=Newark; ComponentLink4URL: https://datasheet.octopart.com:443/RC0402FR-0710KL-Yageo-datasheet-8324527.pdf?src-supplier=Newark; ComponentLink4Description: https://datasheet.octopart.com:443/RC0402FR-0710KL-Yageo-datasheet-8324527.pdf?src-supplier=Newark; ComponentLink5URL: https://datasheet.octopart.com:443/RC0402FR-0710KL-Yageo-datasheet-10408619.pdf?src-supplier=element14+APAC; ComponentLink5Description: https://datasheet.octopart.com:443/RC0402FR-0710KL-Yageo-datasheet-10408619.pdf?src-supplier=element14+APAC; ComponentLink6URL: https://datasheet.octopart.com:443/RC0402FR-0710KL-Yageo-datasheet-62067350.pdf?src-supplier=element14+APAC; ComponentLink6Description: https://datasheet.octopart.com:443/RC0402FR-0710KL-Yageo-datasheet-62067350.pdf?src-supplier=element14+APAC; ComponentLink7URL: https://datasheet.octopart.com:443/RC0402FR-0710KL-Yageo-datasheet-21426659.pdf?src-supplier=element14+APAC; ComponentLink7Description: https://datasheet.octopart.com:443/RC0402FR-0710KL-Yageo-datasheet-21426659.pdf?src-supplier=element14+APAC; ComponentLink8URL: https://datasheet.octopart.com:443/RC0402FR-0710KL-Yageo-datasheet-164759695.pdf?src-supplier=Upverter; ComponentLink8Description: https://datasheet.octopart.com:443/RC0402FR-0710KL-Yageo-datasheet-164759695.pdf?src-supplier=Upverter; ComponentLink9URL: https://datasheet.octopart.com:443/RC0402FR-0710KL-Yageo-datasheet-103092701.pdf?src-supplier=Upverter; ComponentLink9Description: https://datasheet.octopart.com:443/RC0402FR-0710KL-Yageo-datasheet-103092701.pdf?src-supplier=Upverter; ComponentLink10URL: https://sigma.octopart.com:443/138820526/technical_drawing/Yageo-RC0402FR-0710KL.pdf?src-supplier=Upverter; ComponentLink10Description: https://sigma.octopart.com:443/138820526/technical_drawing/Yageo-RC0402FR-0710KL.pdf?src-supplier=Upverter; ComponentLink11URL: https://datasheet.octopart.com:443/RC0402FR-0710KL-Yageo-datasheet-98239111.pdf?src-supplier=Upverter; ComponentLink11Description: https://datasheet.octopart.com:443/RC0402FR-0710KL-Yageo-datasheet-98239111.pdf?src-supplier=Upverter; ComponentLink12URL: https://datasheet.octopart.com:443/RC0402FR-0710KL-Yageo-datasheet-68298067.pdf?src-supplier=Upverter; ComponentLink12Description: https://datasheet.octopart.com:443/RC0402FR-0710KL-Yageo-datasheet-68298067.pdf?src-supplier=Upverter; ComponentLink13URL: https://datasheet.octopart.com:443/RC0402FR-0710KL-Yageo-datasheet-68297981.pdf?src-supplier=Upverter; ComponentLink13Description: https://datasheet.octopart.com:443/RC0402FR-0710KL-Yageo-datasheet-68297981.pdf?src-supplier=Upverter; ComponentLink14URL: https://datasheet.octopart.com:443/RC0402FR-0710KL-Yageo-datasheet-141435361.pdf?src-supplier=Upverter; ComponentLink14Description: https://datasheet.octopart.com:443/RC0402FR-0710KL-Yageo-datasheet-141435361.pdf?src-supplier=Upverter; ComponentLink15URL: https://datasheet.octopart.com:443/RC0402FR-0710KL-Yageo-datasheet-12509768.pdf?src-supplier=Upverter; ComponentLink15Description: https://datasheet.octopart.com:443/RC0402FR-0710KL-Yageo-datasheet-12509768.pdf?src-supplier=Upverter; ComponentLink16URL: https://datasheet.octopart.com:443/RC0402FR-0710KL-Yageo-datasheet-8329306.pdf?src-supplier=element14; ComponentLink16Description: https://datasheet.octopart.com:443/RC0402FR-0710KL-Yageo-datasheet-8329306.pdf?src-supplier=element14; ComponentLink17URL: https://datasheet.octopart.com:443/RC0402FR-0710KL-Yageo-datasheet-505231.pdf?src-supplier=element14; ComponentLink17Description: https://datasheet.octopart.com:443/RC0402FR-0710KL-Yageo-datasheet-505231.pdf?src-supplier=element14; ComponentLink18URL: https://datasheet.octopart.com:443/RC0402FR-0710KL-Yageo-datasheet-175423674.pdf?src-supplier=SOS+electronic; ComponentLink18Description: https://datasheet.octopart.com:443/RC0402FR-0710KL-Yageo-datasheet-175423674.pdf?src-supplier=SOS+electronic; ComponentLink19URL: https://datasheet.octopart.com:443/RC0402FR-0710KL-Yageo-datasheet-137700087.pdf?src-supplier=Future+Electronics; ComponentLink19Description: https://datasheet.octopart.com:443/RC0402FR-0710KL-Yageo-datasheet-137700087.pdf?src-supplier=Future+Electronics; ComponentLink20URL: https://datasheet.octopart.com:443/RC0402FR-0710KL-Yageo-datasheet-8324255.pdf?src-supplier=Future+Electronics; ComponentLink20Description: https://datasheet.octopart.com:443/RC0402FR-0710KL-Yageo-datasheet-8324255.pdf?src-supplier=Future+Electronics; ComponentLink21URL: https://datasheet.octopart.com:443/RC0402FR-0710KL-Yageo-datasheet-79472498.pdf?src-supplier=Megastar; ComponentLink21Description: https://datasheet.octopart.com:443/RC0402FR-0710KL-Yageo-datasheet-79472498.pdf?src-supplier=Megastar; ComponentLink22URL: https://datasheet.octopart.com/RC0402FR-0710KL-Yageo-datasheet-73766026.pdf; ComponentLink22Description: https://datasheet.octopart.com/RC0402FR-0710KL-Yageo-datasheet-73766026.pdf; ComponentLink23URL: http://sigma.octopart.com:80/conflict_mineral_statement/Yageo-company-3.pdf?src-supplier=Compliance+Statements; ComponentLink23Description: http://sigma.octopart.com:80/conflict_mineral_statement/Yageo-company-3.pdf?src-supplier=Compliance+Statements; ComponentLink24URL: http://sigma.octopart.com:80/rohs_statement/Yageo-company-2.pdf?src-supplier=Compliance+Statements; ComponentLink24Description: http://sigma.octopart.com:80/rohs_statement/Yageo-company-2.pdf?src-supplier=Compliance+Statements; Supplier 1: DigiKey; Supplier Part Number 1: 311-10.0KLRDKR-ND; Supplier 2: DigiKey; Supplier Part Number 2: 311-10.0KLRCT-ND; Supplier 3: Mouser; Supplier Part Number 3: 603-RC0402FR-0710KL
SW1 = 8SS1012-Z: Switch Slide ON ON SPDT Top Slide 6A 250VAC 30VDC 100000Cycles PC Pins Thru-Hole Bag; Manufacturer_Name: Nidec Copal Electronics; Manufacturer: Nidec Copal; Actuator Length: 5mm; Contact Style: Non-Shorting; Current Rating: 4A; Electrical Life: 30kcycles; Mechanical Life: 100kcycles; Switch Function: On-On; Switch Travel: 2.2mm; Voltage Rating (AC): 125V; Voltage Rating (DC): 30V; Type: Slide Switches; Copyright: Copyright (C) 2025 Ultra Librarian. All rights reserved.; Manufacturer_Part_Number: 8SS1012-Z; RefDes: RefDes; Supplier: Arrow Electronics; Supplier Part Number: 8SS1012-Z; Manufacturer Part Number: 8SS1012-Z; RoHS: Compliant; Category: Slide Switches; Stock: 1202; Pricing: 2=1,567 (USD); Contact Current Rating: 6A; Contact Plating: Silver; Export Control Classification Number (ECCN) Code: EAR99; Harmonized Tariff Schedule (HTS) Code: 8536.50.70.00; Introduction Date: 2016-11-16; Lifecycle Status: Production; Max Operating Temperature: 85°C; Min Operating Temperature: -30°C; Mounting Technology: Through Hole; Orientation: Vertical; Termination: PC Pin; Throw Configuration: SPDT; ComponentLink1URL: https://datasheet.octopart.com:443/8SS1012-Z-Nidec-Copal-datasheet-180925849.pdf?src-supplier=IHS; ComponentLink1Description: https://datasheet.octopart.com:443/8SS1012-Z-Nidec-Copal-datasheet-180925849.pdf?src-supplier=IHS; ComponentLink2URL: https://datasheet.octopart.com:443/8SS1012-Z-Nidec-datasheet-158724552.pdf?src-supplier=RS+(Formerly+Allied+Electronics); ComponentLink2Description: https://datasheet.octopart.com:443/8SS1012-Z-Nidec-datasheet-158724552.pdf?src-supplier=RS+(Formerly+Allied+Electronics)
U1 = USBLC6-2SC6: TVS Diode Array Uni-Directional USBLC6-2SC6 17V; Manufacturer 1: STMicroelectronics; Datasheet: https://www.st.com/resource/en/datasheet/usblc6-2.pdf; Height: 1.45mm; Manufacturer Part Number 1: USBLC6-2SC6; Supplier Part Number 1: 511-USBLC6-2SC6; Supplier Link 1: https://br.mouser.com/ProductDetail/STMicroelectronics/USBLC6-2SC6?qs=po45yt2pPpu%2FhNIlwQdTlg%3D%3D&srsltid=AfmBOoqislOEDh1UBDOoi8KtJgWNZBCyfvAKcoWTZlt-wyjpMBhjDG33; Supplier 1: Mouser; Supplier Unit Price 1: 0.36